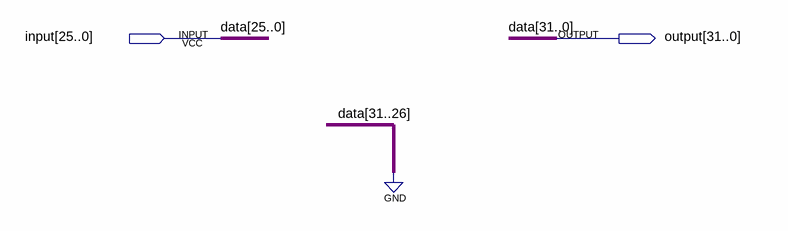
[diagram p0: schematic sheet]
// Quartus schematic zero_extended.bdf as structural Verilog: 0 symbols, 2 pins
module zero_extended (
  input  [25:0] \input ,
  output [31:0] \output 
);


  assign \output  = {{6{1'b0}}, \input };

  // Other names for the same wires on the sheet: data[25:0] = \input 
endmodule
